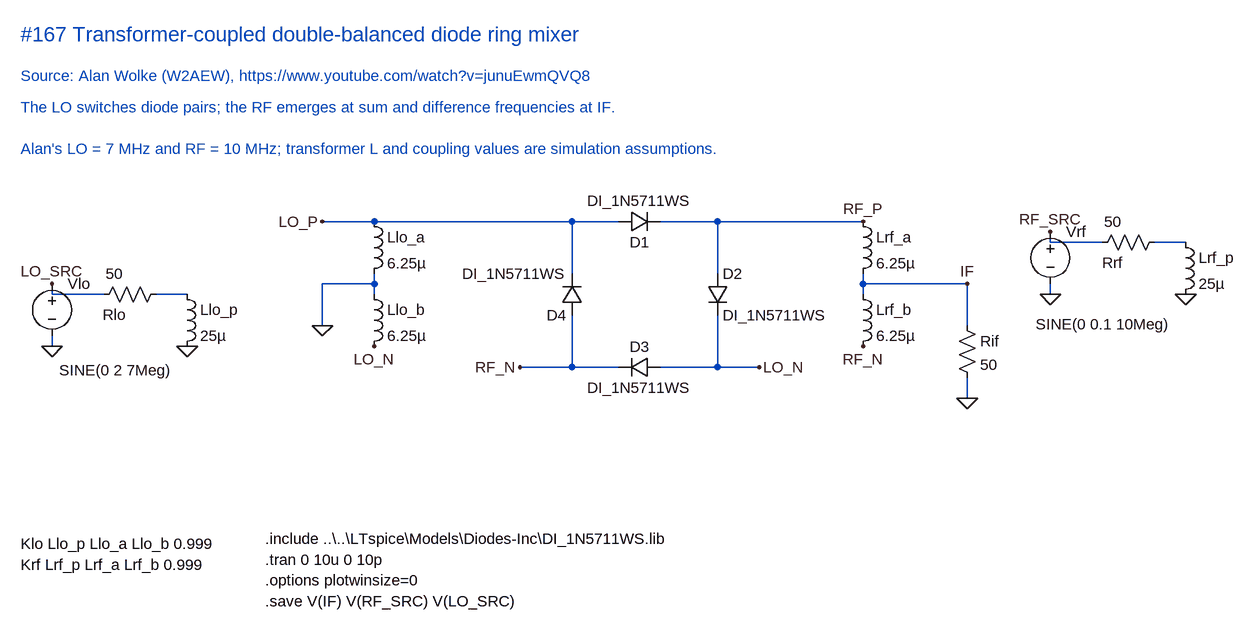
[diagram p0: schematic Diode ring mixer conversion example.asc]
Diode ring mixer conversion example.asc, the LTspice schematic file:
Version 4.1
SHEET 1 2200 1200
WIRE -256 16 -336 16
WIRE 48 16 -256 16
WIRE 120 16 48 16
WIRE 272 16 184 16
WIRE 496 16 272 16
WIRE 784 48 784 32
WIRE 864 48 784 48
WIRE 992 48 944 48
WIRE 48 96 48 16
WIRE 272 96 272 16
WIRE -256 112 -256 96
WIRE -256 112 -336 112
WIRE -336 176 -336 112
WIRE 496 112 496 96
WIRE 656 112 496 112
WIRE 784 128 784 112
WIRE -256 128 -256 112
WIRE 496 128 496 112
WIRE 656 176 656 112
WIRE 48 240 48 160
WIRE 48 240 -32 240
WIRE 120 240 48 240
WIRE 272 240 272 160
WIRE 272 240 184 240
WIRE 336 240 272 240
WIRE 656 288 656 256
WIRE -752 128 -752 112
WIRE -672 128 -752 128
WIRE -544 128 -592 128
WIRE -752 208 -752 192
FLAG -336 176 0
FLAG -336 16 LO_P
FLAG -256 208 LO_N
FLAG 336 240 LO_N
FLAG -32 240 RF_N
FLAG 496 208 RF_N
FLAG 656 112 IF
FLAG 496 16 RF_P
FLAG -752 208 0
FLAG -544 208 0
FLAG 784 128 0
FLAG 992 128 0
FLAG 656 288 0
FLAG -752 112 LO_SRC
FLAG 784 32 RF_SRC
SYMBOL diode 120 32 R270
WINDOW 0 0 32 VBottom 2
WINDOW 3 32 32 VTop 2
SYMATTR InstName D1
SYMATTR Value DI_1N5711WS
SYMBOL diode 256 96 R0
SYMATTR InstName D2
SYMATTR Value DI_1N5711WS
SYMBOL diode 184 224 R90
WINDOW 0 0 32 VBottom 2
WINDOW 3 32 32 VTop 2
SYMATTR InstName D3
SYMATTR Value DI_1N5711WS
SYMBOL diode 64 160 R180
SYMATTR InstName D4
SYMATTR Value DI_1N5711WS
SYMBOL ind -272 0 R0
SYMATTR InstName Llo_a
SYMATTR Value 6.25µ
SYMATTR Type ind
SYMBOL ind -272 112 R0
SYMATTR InstName Llo_b
SYMATTR Value 6.25µ
SYMATTR Type ind
SYMBOL ind 480 0 R0
SYMATTR InstName Lrf_a
SYMATTR Value 6.25µ
SYMATTR Type ind
SYMBOL ind 480 112 R0
SYMATTR InstName Lrf_b
SYMATTR Value 6.25µ
SYMATTR Type ind
SYMBOL ind -560 112 R0
SYMATTR InstName Llo_p
SYMATTR Value 25µ
SYMATTR Type ind
SYMBOL ind 976 32 R0
SYMATTR InstName Lrf_p
SYMATTR Value 25µ
SYMATTR Type ind
SYMBOL res -688 144 R270
WINDOW 0 0 32 VBottom 2
WINDOW 3 32 32 VTop 2
SYMATTR InstName Rlo
SYMATTR Value 50
SYMBOL res 848 64 R270
WINDOW 0 0 32 VBottom 2
WINDOW 3 32 32 VTop 2
SYMATTR InstName Rrf
SYMATTR Value 50
SYMBOL res 640 160 R0
SYMATTR InstName Rif
SYMATTR Value 50
SYMBOL voltage -752 96 R0
WINDOW 3 98 149 Center 2
SYMATTR Value SINE(0 2 7Meg)
SYMATTR InstName Vlo
SYMBOL voltage 784 16 R0
WINDOW 3 81 158 Center 2
SYMATTR Value SINE(0 0.1 10Meg)
SYMATTR InstName Vrf
TEXT -800 -272 Left 3 ;#167 Transformer-coupled double-balanced diode ring mixer
TEXT -800 -208 Left 2 ;Source: Alan Wolke (W2AEW), https://www.youtube.com/watch?v=junuEwmQVQ8
TEXT -800 -160 Left 2 ;The LO switches diode pairs; the RF emerges at sum and difference frequencies at IF.
TEXT -800 -96 Left 2 ;Alan's LO = 7 MHz and RF = 10 MHz; transformer L and coupling values are simulation assumptions.
TEXT -800 512 Left 2 !Klo Llo_p Llo_a Llo_b 0.999
TEXT -800 544 Left 2 !Krf Lrf_p Lrf_a Lrf_b 0.999
TEXT -424 504 Left 2 !.include ..\\..\\LTspice\\Models\\Diodes-Inc\\DI_1N5711WS.lib
TEXT -424 536 Left 2 !.tran 0 10u 0 10p
TEXT -424 568 Left 2 !.options plotwinsize=0
TEXT -424 600 Left 2 !.save V(IF) V(RF_SRC) V(LO_SRC)

The netlist it stands for:
* Diode ring mixer conversion example.asc
D1 LO_P RF_P DI_1N5711WS
D2 RF_P LO_N DI_1N5711WS
D3 LO_N RF_N DI_1N5711WS
D4 RF_N LO_P DI_1N5711WS
Llo_a LO_P 0 6.25µ
Llo_b 0 LO_N 6.25µ
Lrf_a RF_P IF 6.25µ
Lrf_b IF RF_N 6.25µ
Llo_p N002 0 25µ
Lrf_p N001 0 25µ
Rlo LO_SRC N002 50
Rrf RF_SRC N001 50
Rif IF 0 50
Vlo LO_SRC 0 SINE(0 2 7Meg)
Vrf RF_SRC 0 SINE(0 0.1 10Meg)
.model D D
.lib standard.dio
* #167 Transformer-coupled double-balanced diode ring mixer
* Source: Alan Wolke (W2AEW), https://www.youtube.com/watch?v=junuEwmQVQ8
* The LO switches diode pairs; the RF emerges at sum and difference frequencies at IF.
* Alan's LO = 7 MHz and RF = 10 MHz; transformer L and coupling values are simulation assumptions.
Klo Llo_p Llo_a Llo_b 0.999
Krf Lrf_p Lrf_a Lrf_b 0.999
.include ..\..\LTspice\Models\Diodes-Inc\DI_1N5711WS.lib
.tran 0 10u 0 10p
.options plotwinsize=0
.save V(IF) V(RF_SRC) V(LO_SRC)
.backanno
.end